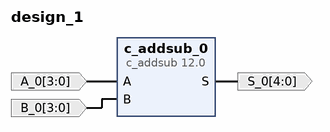
[diagram p0: block diagram of the top level]
# Vivado block design design_1, xc7s50csga324-1, Vivado 2023.2
create_bd_design design_1

create_bd_port -dir I -from 3 -to 0 -type data A_0
create_bd_port -dir I -from 3 -to 0 -type data B_0
create_bd_port -dir O -from 4 -to 0 -type data S_0

create_bd_cell -type ip -vlnv xilinx.com:ip:c_addsub:12.0 c_addsub_0
set_property -dict [list \
  CONFIG.A_Type Unsigned \
  CONFIG.A_Width 4 \
  CONFIG.Add_Mode Add_Subtract \
  CONFIG.B_Type Unsigned \
  CONFIG.B_Value 0000 \
  CONFIG.B_Width 4 \
  CONFIG.Latency 0 \
  CONFIG.Out_Width 5 \
] [get_bd_cells c_addsub_0]

# ---- connections ----

connect_bd_net -net A_0_1 [get_bd_ports A_0] [get_bd_pins c_addsub_0/A]
connect_bd_net -net B_0_1 [get_bd_ports B_0] [get_bd_pins c_addsub_0/B]
connect_bd_net [get_bd_pins c_addsub_0/S] [get_bd_ports S_0]

validate_bd_design
save_bd_design
